# EAGLE design LED-controller-3 (EAGLE 9.6.2)
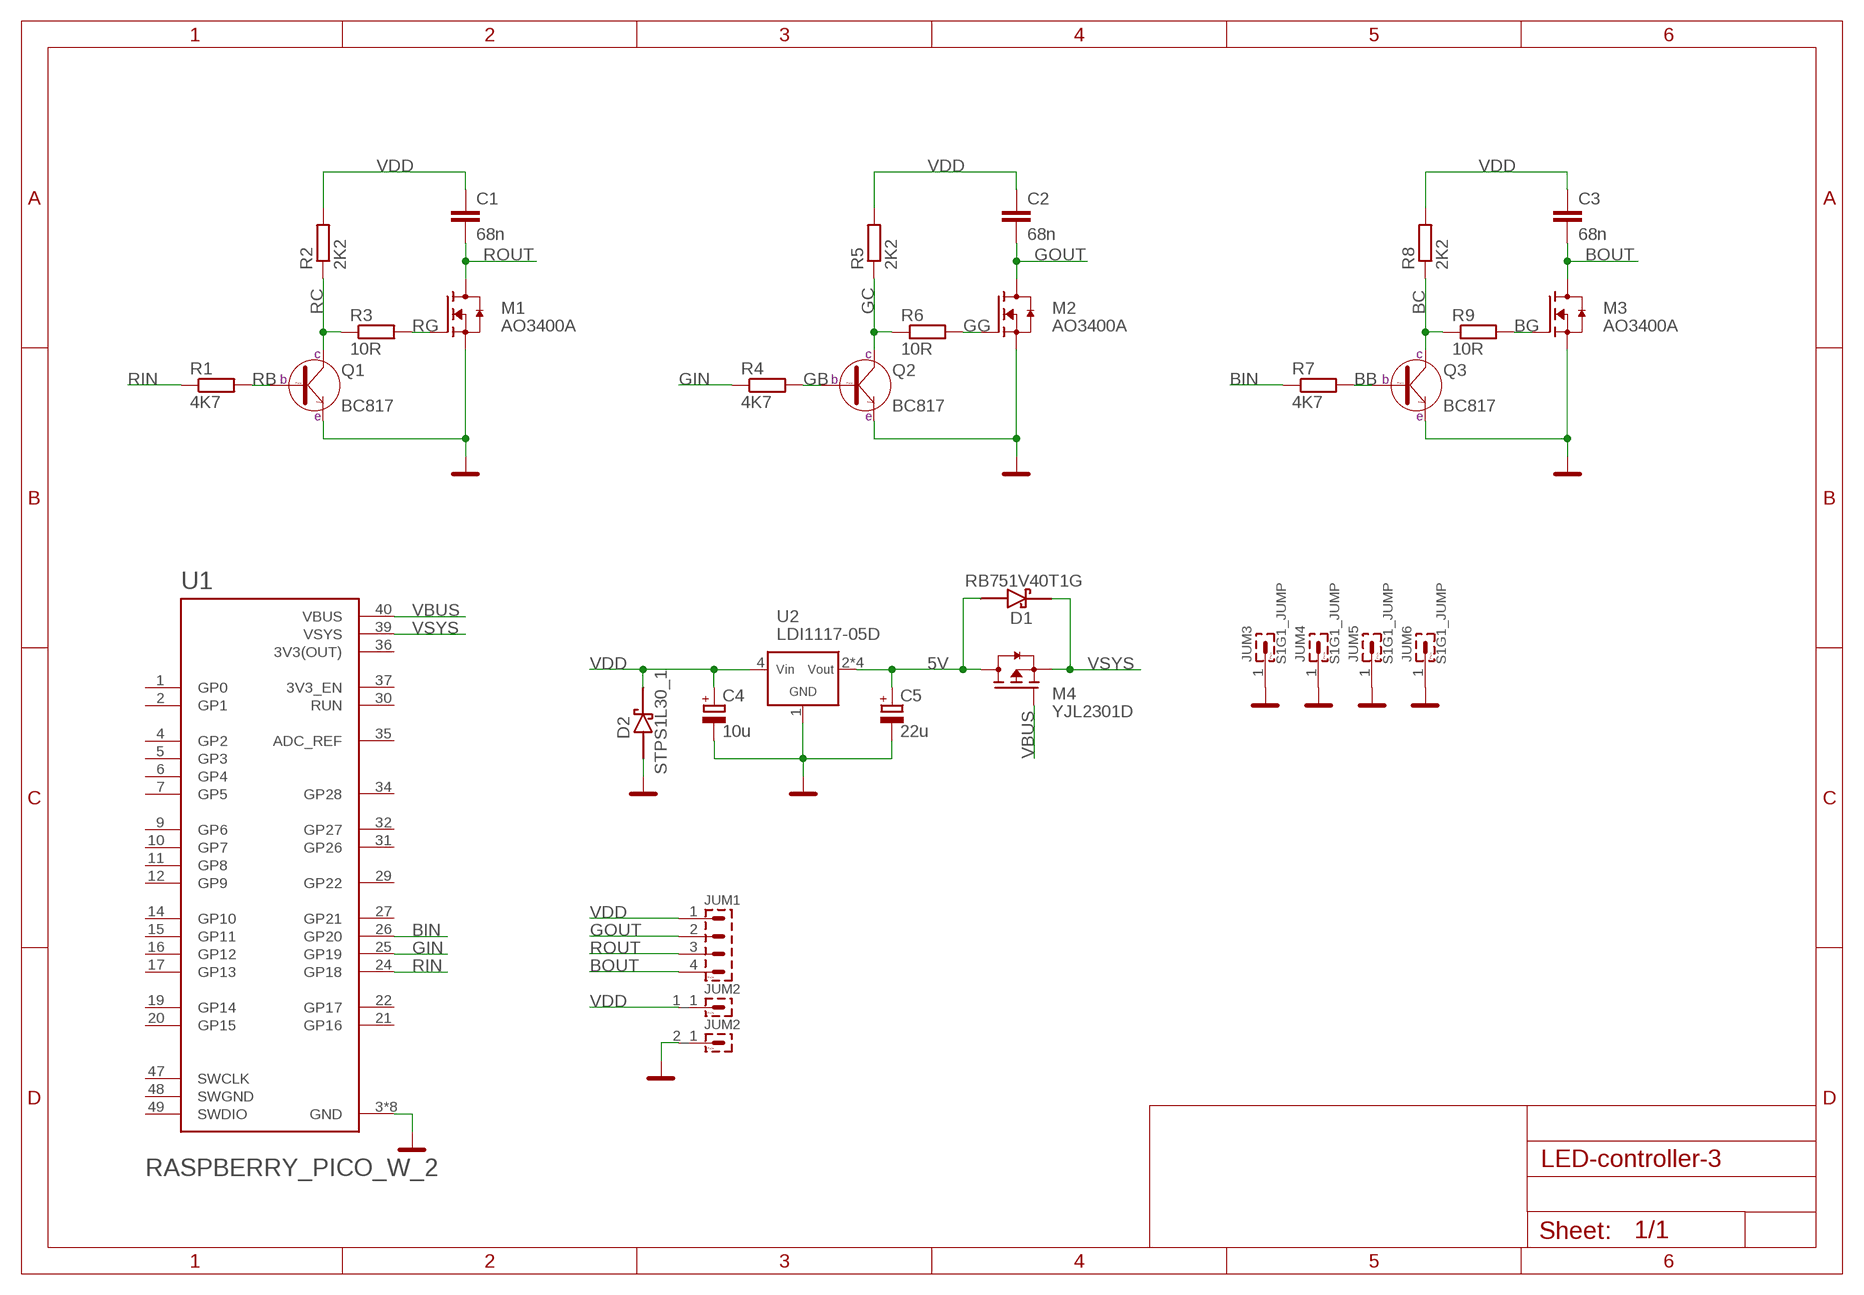
[diagram p0: schematic, sheet 1]

## Parts
C1  68n  C-EUC0603  [C0603]
C2  68n  C-EUC0603  [C0603]
C3  68n  C-EUC0603  [C0603]
C4  10u  C_TAN_BSMCB  [SMC_B]
C5  22u  C_TAN_ASMCA  [SMC_A]
D1  RB751V40T1G  [SOD323]
D2  STPS1L30_1  [SMA]
JUM1  S1G4_JUMP  [S1G4_JUM]
JUM2  S2G1_JUMP-BACKUP  [S2G1_JUM]
JUM3  S1G1_JUMP  [S1G1_JUM]
JUM4  S1G1_JUMP  [S1G1_JUM]
JUM5  S1G1_JUMP  [S1G1_JUM]
JUM6  S1G1_JUMP  [S1G1_JUM]
M1  AO3400A  2N7002  [SOT23]
M2  AO3400A  2N7002  [SOT23]
M3  AO3400A  2N7002  [SOT23]
M4  YJL2301D  [SOT23_2]
Q1  BC817  [SOT-23]
Q2  BC817  [SOT-23]
Q3  BC817  [SOT-23]
R1  4K7  R-EU_R0603  [R0603]
R2  2K2  R-EU_R0603  [R0603]
R3  10R  R-EU_R0603  [R0603]
R4  4K7  R-EU_R0603  [R0603]
R5  2K2  R-EU_R0603  [R0603]
R6  10R  R-EU_R0603  [R0603]
R7  4K7  R-EU_R0603  [R0603]
R8  2K2  R-EU_R0603  [R0603]
R9  10R  R-EU_R0603  [R0603]
U1  RASPBERRY_PICO_W_2  [RPI_PICO_W]
U2  LDI1117-05D  [SO8]

## Nets
5V: C5.+ D1.2(A) M4.3(D) U2.2(VOUT) U2.3(VOUT) U2.6(VOUT) U2.7(VOUT)
BB: Q3.1(B) R7.2
BC: Q3.3(C) R8.1 R9.1
BG: M3.1(G) R9.2
BIN: R7.1 U1.26(GP20)
BOUT: C3.2 JUM1.4 M3.3(D)
GB: Q2.1(B) R4.2
GC: Q2.3(C) R5.1 R6.1
GG: M2.1(G) R6.2
GIN: R4.1 U1.25(GP19)
GND: C4.- C5.- D2.2(A) JUM2.2_1 JUM3.1 JUM4.1 JUM5.1 JUM6.1 M1.2(S) M2.2(S) M3.2(S) Q1.2(E) Q2.2(E) Q3.2(E) U1.3(GND) U1.8(GND) U1.13(GND) U1.18(GND) U1.23(GND) U1.28(GND) U1.33(GND) U1.38(GND) U2.1(GND)
GOUT: C2.2 JUM1.2 M2.3(D)
RB: Q1.1(B) R1.2
RC: Q1.3(C) R2.1 R3.1
RG: M1.1(G) R3.2
RIN: R1.1 U1.24(GP18)
ROUT: C1.2 JUM1.3 M1.3(D)
VBUS: M4.1(G) U1.40(VBUS)
VDD: C1.1 C2.1 C3.1 C4.+ D2.1(C) JUM1.1 JUM2.1_1 R2.2 R5.2 R8.2 U2.4(VIN)
VSYS: D1.1(C) M4.2(S) U1.39(VSYS)
Unconnected: U1.1(GP0) U1.2(GP1) U1.4(GP2) U1.5(GP3) U1.6(GP4) U1.7(GP5) U1.9(GP6) U1.10(GP7) U1.11(GP8) U1.12(GP9) U1.14(GP10) U1.15(GP11) U1.16(GP12) U1.17(GP13) U1.19(GP14) U1.20(GP15) U1.21(GP16) U1.22(GP17) U1.27(GP21) U1.29(GP22) U1.30(RUN) U1.31(GP26) U1.32(GP27) U1.34(GP28) U1.35(ADC_REF) U1.37(3V3_EN) U1.47(SWCLK) U1.49(SWDIO)

## Power pins joined to a net without a drawn wire
3V3(OUT): U1.36(3V3(OUT))
SWGND: U1.48(SWGND)

## Library data of the parts
C1-C3 = #_NG_knihovna:C-EU: CAPACITOR, European symbol; SPICEPREFIX: C
C4 = #_NG_knihovna:C_TAN_B: POLARIZED CAPACITOR, European symbol; SPICEPREFIX: C
C5 = #_NG_knihovna:C_TAN_A: POLARIZED CAPACITOR, European symbol; SPICEPREFIX: C
D1 = #_NG_knihovna:RB751V40T1G
D2 = #_NG_knihovna:STPS1L30
JUM1 = #_NG_knihovna:S1G4_JUMP: Radove konektory - koliky - 4x
JUM2 = #_NG_knihovna:S2G1_JUMP-BACKUP: Radove konektory - koliky - dvojite - 2x1
JUM3-JUM6 = #PaJa_konektory:S1G1_JUMP: Radove konektory - koliky - 1x
M1-M3 = #_NG_knihovna:2N7002
M4 = #_NG_knihovna:YJL2301D
Q1-Q3 = #PaJa_31:BC817: SMD tranzistor - NPN - ekv. BC337
R1-R9 = #_NG_knihovna:R-EU_: RESISTOR, European symbol; SPICEPREFIX: R
U1 = #_NG_knihovna:RASPBERRY_PICO_W_2
U2 = #_NG_knihovna:LDI1117-05D

## Board
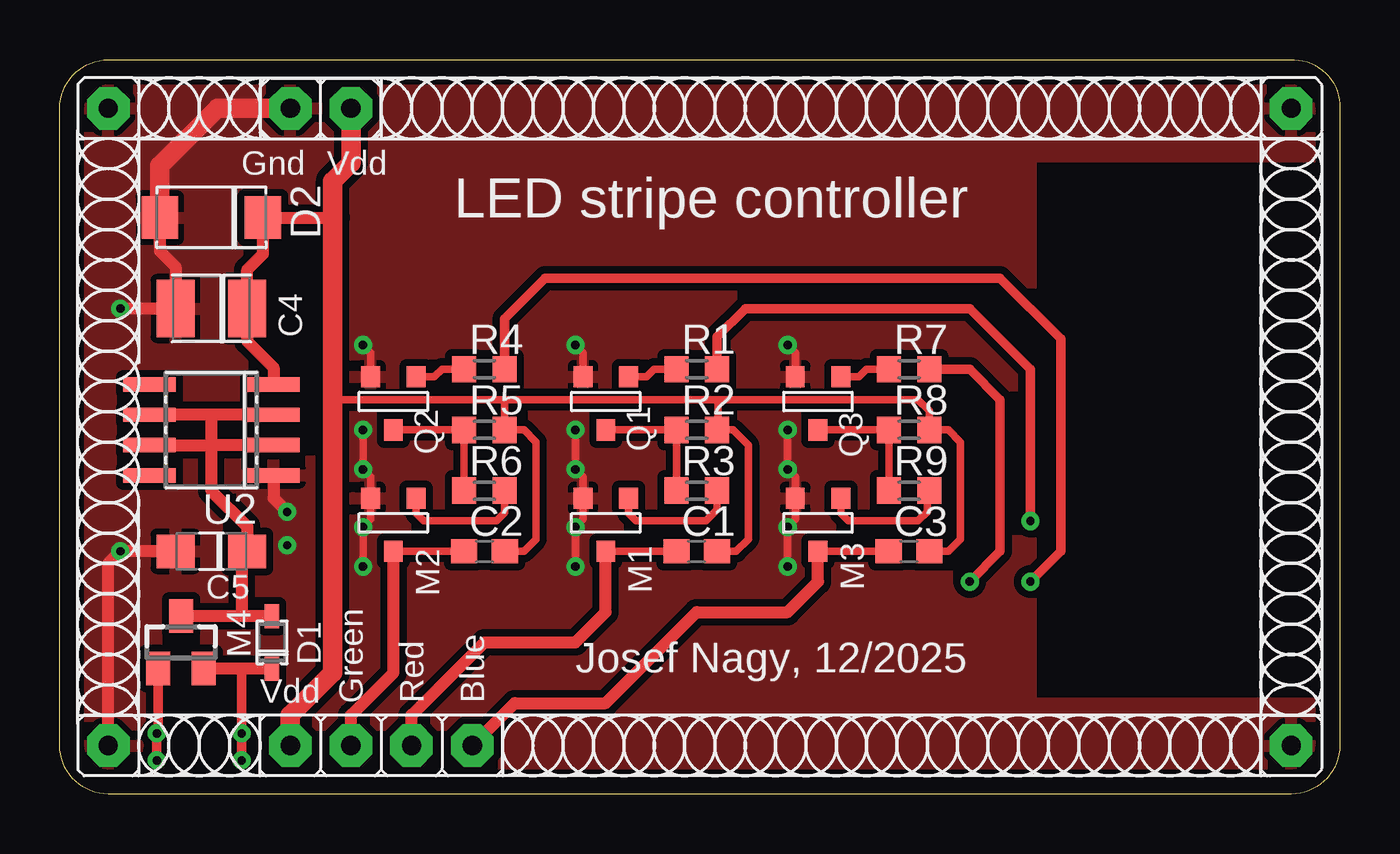
[diagram p1: board, top side]
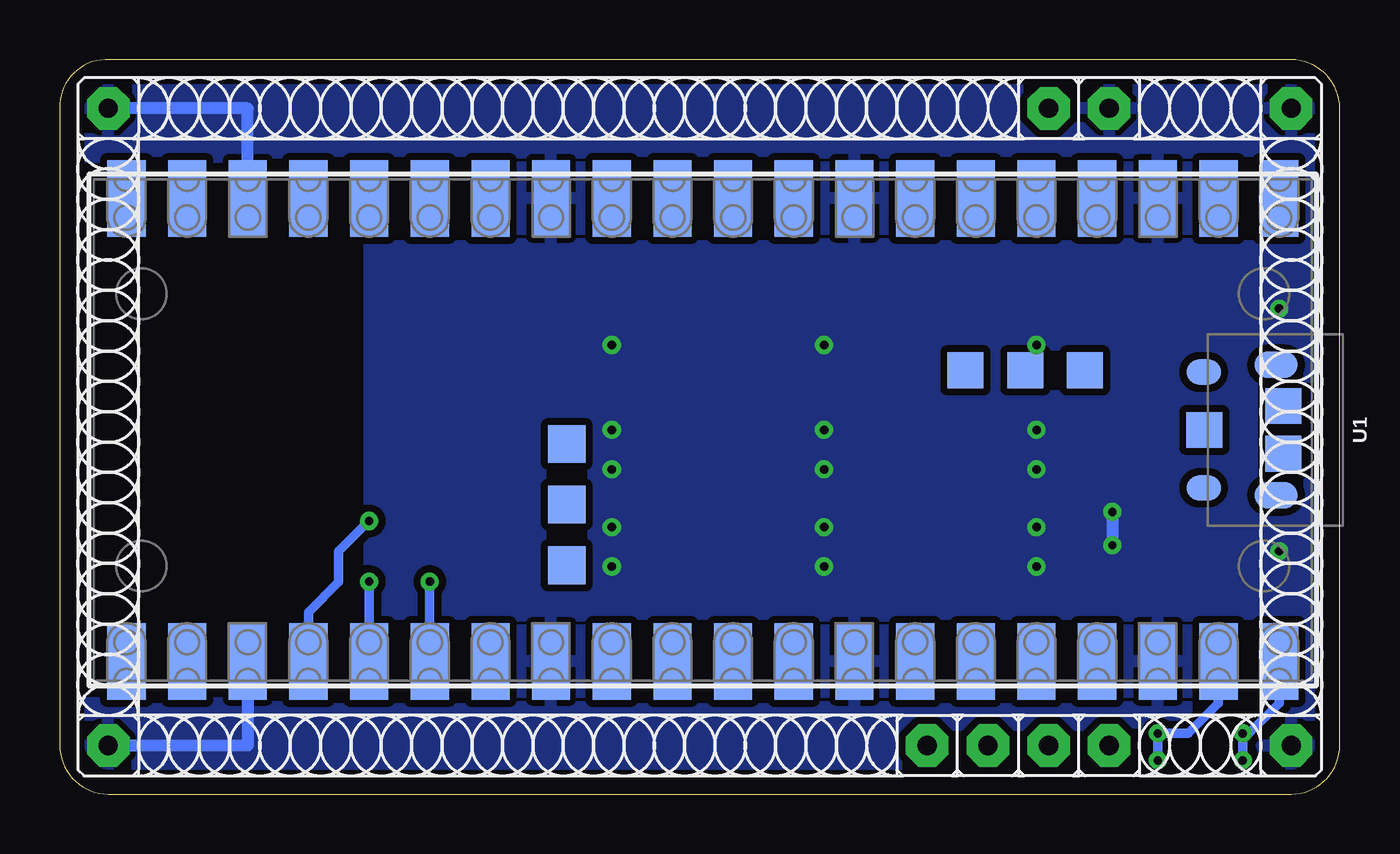
[diagram p2: board, bottom side, seen from below]

Size 53.59 x 30.73 mm. Coordinates in mm from the lower left corner, seen from the top.
Outline: 2.03,30.73 51.69,30.73 arc-90 53.59,28.7 53.59,2.03 arc-90 51.56,0 2.03,0 arc-90 0,2.03 0,28.7 arc-90 2.03,30.73
Copper layers (1*16): Top 0.035mm / dielectric 1.5mm / Bottom 0.035mm
Design rules "default": minimum track width 6mil, minimum drill 0.35mm, track to track 6mil, track to pad 6mil, pad to pad 6mil, via to via 6mil, smd to smd 6mil, copper to edge 40mil, drill to drill 6mil, minimum pad ring 10mil, minimum via ring 8mil, stop-mask expansion 4mil, vias tented up to drill 0mil, thermal gap 10mil

### Footprints (pad centres in the part's own frame; a part is rotated, then mirrored left to right if it is on the bottom)
C0603 = smd 1.1 x 1: 1 -0.85,0; 2 0.85,0
SMC_B = smd 1.6 x 2.4: + -1.5,0; - 1.5,0
SMC_A = smd 1.6 x 1.4: + -1.5,0; - 1.5,0
SOD323 = smd 1 x 0.6: 1 -1.1,0; 2 1.1,0
SMA = smd 1.524 x 1.778: 1 -2.159,0; 2 2.159,0
S1G4_JUM = drill 0.813 pad 1.778 octagon: 1 -3.81,0; 2 -1.27,0; 3 1.27,0; 4 3.81,0
S2G1_JUM = drill 0.813 pad 1.778 octagon: 1_1 0,-1.27; 2_1 0,1.27
S1G1_JUM = drill 0.8 pad 1.778 octagon: 1 0,0
SOT23 = smd 0.787 x 0.889: 1 -0.953,-0.953; 2 0.953,-0.953; 3 0,1.27
SOT23_2 = smd 1 x 1.4: 1 -0.95,-1.1; 2 0.95,-1.1; 3 0,1.1
SOT-23 = smd 0.787 x 0.889: 1 -0.953,-0.953; 2 0.953,-0.953; 3 0,1.27
R0603 = smd 1 x 1.1: 1 -0.85,0; 2 0.85,0
RPI_PICO_W = smd 3.2 x 1.6: 1 -9.69,24.13; 2 -9.69,21.59; 3 -9.69,19.05; 4 -9.69,16.51; 5 -9.69,13.97; 6 -9.69,11.43; 7 -9.69,8.89; 8 -9.69,6.35; 9 -9.69,3.81; 10 -9.69,1.27; 11 -9.69,-1.27; 12 -9.69,-3.81; 13 -9.69,-6.35; 14 -9.69,-8.89; 15 -9.69,-11.43; 16 -9.69,-13.97; 17 -9.69,-16.51; 18 -9.69,-19.05; 19 -9.69,-21.59; 20 -9.69,-24.13; 21 9.69,-24.13; 22 9.69,-21.59; 23 9.69,-19.05; 24 9.69,-16.51; 25 9.69,-13.97; 26 9.69,-11.43; 27 9.69,-8.89; 28 9.69,-6.35; 29 9.69,-3.81; 30 9.69,-1.27; 31 9.69,1.27; 32 9.69,3.81; 33 9.69,6.35; 34 9.69,8.89; 35 9.69,11.43; 36 9.69,13.97; 37 9.69,16.51; 38 9.69,19.05; 39 9.69,21.59; 40 9.69,24.13 | smd 1.5 x 1.5: 41 0,21; 42 1,24.3; 43 -1,24.3; 44 -2.5,16; 45 -2.5,13.5; 46 -2.5,11 | smd 1.575 x 1.575: 47 0.584,-5.7; 48 3.124,-5.7; 49 5.664,-5.7 | smd 1.1 x 1.8: A -2.725,24; B 2.725,24 | smd 1.05 x 1.45: C -2.425,20.97; D 2.425,20.97
SO8 = smd 0.6 x 2.2: 1 -1.905,-2.6; 2 -0.635,-2.6; 3 0.635,-2.6; 4 1.905,-2.6; 5 1.905,2.6; 6 0.635,2.6; 7 -0.635,2.6; 8 -1.905,2.6

### Placement (x,y rotation side)
C1  26.67,10.16 180 top
C2  17.78,10.16 180 top
C3  35.56,10.16 180 top
C4  6.35,20.32 180 top
C5  6.35,10.16 180 top
D1  8.89,6.35 90 top
D2  6.35,24.13 180 top
JUM1  13.46,2.03 0 top
JUM2  10.92,28.7 90 top
JUM3  2.03,2.03 0 top
JUM4  2.03,28.7 0 top
JUM5  51.56,2.03 0 top
JUM6  51.56,28.7 0 top
M1  22.86,11.43 180 top
M2  13.97,11.43 180 top
M3  31.75,11.43 180 top
M4  5.08,6.35 0 top
Q1  22.86,16.51 180 top
Q2  13.97,16.51 180 top
Q3  31.75,16.51 180 top
R1  26.67,17.78 180 top
R2  26.67,15.24 0 top
R3  26.67,12.7 0 top
R4  17.78,17.78 180 top
R5  17.78,15.24 0 top
R6  17.78,12.7 0 top
R7  35.56,17.78 180 top
R8  35.56,15.24 0 top
R9  35.56,12.7 0 top
U1  26.67,15.24 270 bottom
U2  6.35,15.24 90 top

### Tracks (layer width: path | path; a pad name or v marks a point on that pad's centre or on a via)
5V
  Top 0.508: U2.3 6.35,15.88 | 6.35,15.88 U2.6 | U2.2 6.35,14.61 | U2.7 6.35,14.61 | 6.35,15.88 6.35,14.61 | 6.35,14.61 6.35,12.7 7.85,11.2 C5.+ 7.62,9.93 7.62,7.45 | D1.2 7.62,7.45 | 7.62,7.45 M4.3
BB
  Top 0.305: Q3.1 33.47,17.46 33.78,17.78 R7.2
BC
  Top 0.305: Q3.3 R8.1 R9.1
BG
  Top 0.305: R9.2 36.32,12.61 36.32,11.81 35.94,11.43 33.02,11.43 32.7,11.75 M3.1
BIN  (via drill 0.35)
  Top 0.406: R7.1 38.1,17.78 39.37,16.51 39.37,10.16 v38.1,8.89
  Bottom 0.406: v38.1,8.89 U1.26
BOUT
  Top 0.305: C3.2 M3.3
  Top 0.508: M3.3 31.75,8.89 30.48,7.62 26.67,7.62 22.86,3.81 19.05,3.81 JUM1.4
GB
  Top 0.305: Q2.1 15.68,17.46 16,17.78 R4.2
GC
  Top 0.305: Q2.3 R5.1 R6.1
GG
  Top 0.305: R6.2 18.63,11.77 18.29,11.43 15.24,11.43 14.92,11.75 M2.1
GIN  (via drill 0.35)
  Top 0.406: R4.1 18.63,19.9 20.32,21.59 39.37,21.59 41.91,19.05 41.91,10.16 v40.64,8.89
  Bottom 0.406: v40.64,8.89 U1.25
GND  (via drill 0.35)
  Top 0.305: v30.48,15.24 v30.48,13.59 30.8,13.27 M3.2 30.8,11.49 v30.48,11.18 v30.48,9.53 | Q3.2 30.8,18.48 v30.48,18.8 | v21.59,15.24 v21.59,13.59 21.91,13.27 M1.2 21.91,11.49 v21.59,11.18 v21.59,9.53 | Q1.2 21.91,18.48 v21.59,18.8 | v12.7,18.8 13.02,18.48 Q2.2 | v12.7,15.24 v12.7,13.59 13.02,13.27 M2.2 13.02,11.49 v12.7,11.18 v12.7,9.53
  Top 0.508: C5.- v2.54,10.16 2.03,9.65 JUM3.1 | D2.2 4.19,22.73 4.85,22.07 C4.- v2.54,20.32 | U2.1 8.95,12.39 v9.53,11.81
  Top 0.813: JUM2.2_1 6.6,28.7 4.19,26.29 D2.2
  Bottom 0.508: v9.53,11.81 v9.53,10.41 | JUM6.1 45.72,28.7 U1.18 | JUM5.1 45.72,2.03 U1.23
  pour Bottom (isolate 0.305): 0,30.48 53.34,30.48 53.34,26.67 40.64,26.67 40.64,3.81 53.34,3.81 53.34,0 0,0
  pour Top (isolate 0.305): 0,30.48 53.34,30.48 53.34,26.67 40.64,26.67 40.64,3.81 53.34,3.81 53.34,0 0,0
GOUT
  Top 0.305: C2.2 M2.3
  Top 0.508: JUM1.2 12.19,3.3 13.97,5.08 M2.3
RB
  Top 0.305: Q1.1 24.57,17.46 24.89,17.78 R1.2
RC
  Top 0.305: Q1.3 R2.1 R3.1
RG
  Top 0.305: R3.2 27.52,11.9 27.05,11.43 24.13,11.43 23.81,11.75 M1.1
RIN  (via drill 0.35)
  Top 0.406: R1.1 27.52,19.14 28.7,20.32 38.1,20.32 40.64,17.78 v40.64,11.43
  Bottom 0.406: v40.64,11.43 41.91,10.16 41.91,8.89 43.18,7.62 U1.24 43.18,5.08
ROUT
  Top 0.305: C1.2 M1.3
  Top 0.508: JUM1.3 14.73,3.3 17.78,6.35 21.59,6.35 22.86,7.62 M1.3
VBUS  (via drill 0.35)
  Top 0.406: M4.1 4.13,2.61 v4.06,2.54 v4.06,1.41
  Bottom 0.406: U1.40 2.54,3.81 3.81,2.54 v4.06,2.54 v4.06,1.41 4.06,1.27
VDD
  Top 0.305: C1.1 28.32,10.16 28.83,10.67 28.83,14.61 28.19,15.24 R2.2 27.56,15.28 27.56,16.51 | C3.1 37.21,10.16 37.72,10.67 37.72,14.73 37.21,15.24 R8.2 36.41,16.04 35.94,16.51 27.56,16.51 | 27.56,16.51 18.67,16.51 | 18.67,16.51 18.63,16.47 R5.2 19.43,15.24 19.94,14.73 19.94,10.67 19.43,10.16 C2.1 | 11.43,16.51 18.67,16.51
  Top 0.508: U2.4 8.95,17.85 7.85,18.95 C4.+ 7.85,21.95 8.51,22.61 D2.1 11.43,24.13
  Top 0.813: JUM1.1 9.65,3.3 11.43,5.08 11.43,16.51 11.43,24.13 11.43,25.65 12.19,26.42 JUM2.1_1
VSYS  (via drill 0.35)
  Top 0.406: 7.62,5.25 v7.62,2.54 v7.62,1.41 7.62,1.27
  Top 0.508: D1.1 7.62,5.25 M4.2
  Bottom 0.406: U1.39 5.08,3.81 6.35,2.54 v7.62,2.54 v7.62,1.41

### Text on the board
tPlace: Gnd | Vdd | Vdd | Green | Red | Blue
tNames: LED stripe controller | Josef Nagy, 12/2025